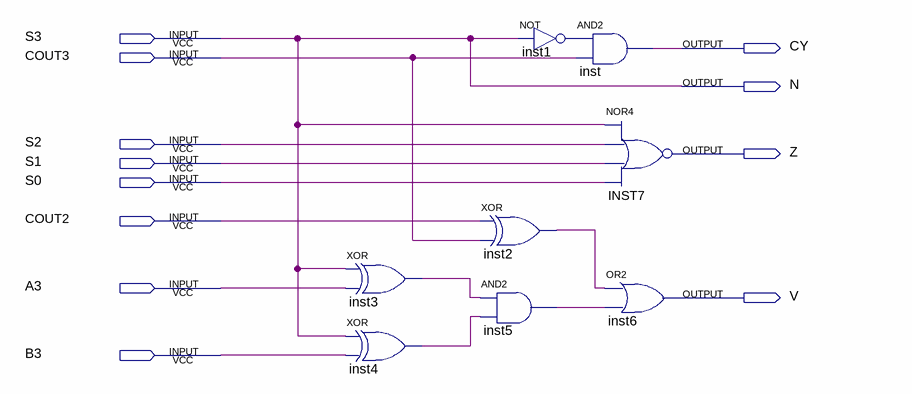
[diagram p0: schematic sheet]
// Quartus schematic state4bit.bdf as structural Verilog: 8 symbols, 12 pins
module state4bit (
  input  S3,
  input  COUT3,
  input  S2,
  input  S1,
  input  S0,
  input  COUT2,
  input  A3,
  input  B3,
  output CY,
  output N,
  output Z,
  output V
);

  wire inst1_out, inst2_out, inst3_out, inst4_out, inst5_out;

  xor inst3 (inst3_out, S3, A3);
  xor inst4 (inst4_out, S3, B3);
  xor inst2 (inst2_out, COUT2, COUT3);
  and inst5 (inst5_out, inst3_out, inst4_out);
  and inst (CY, inst1_out, COUT3);
  not inst1 (inst1_out, S3);
  nor INST7 (Z, S3, S2, S1, S0);
  or inst6 (V, inst2_out, inst5_out);

  assign N = S3;
endmodule
